# Altium schematic sheet Top_Sheet.SchDoc: Skipper Top Sheet
size 297 x 210 mm; Author: Jack Herron; SheetNumber: 1; SheetTotal: 11
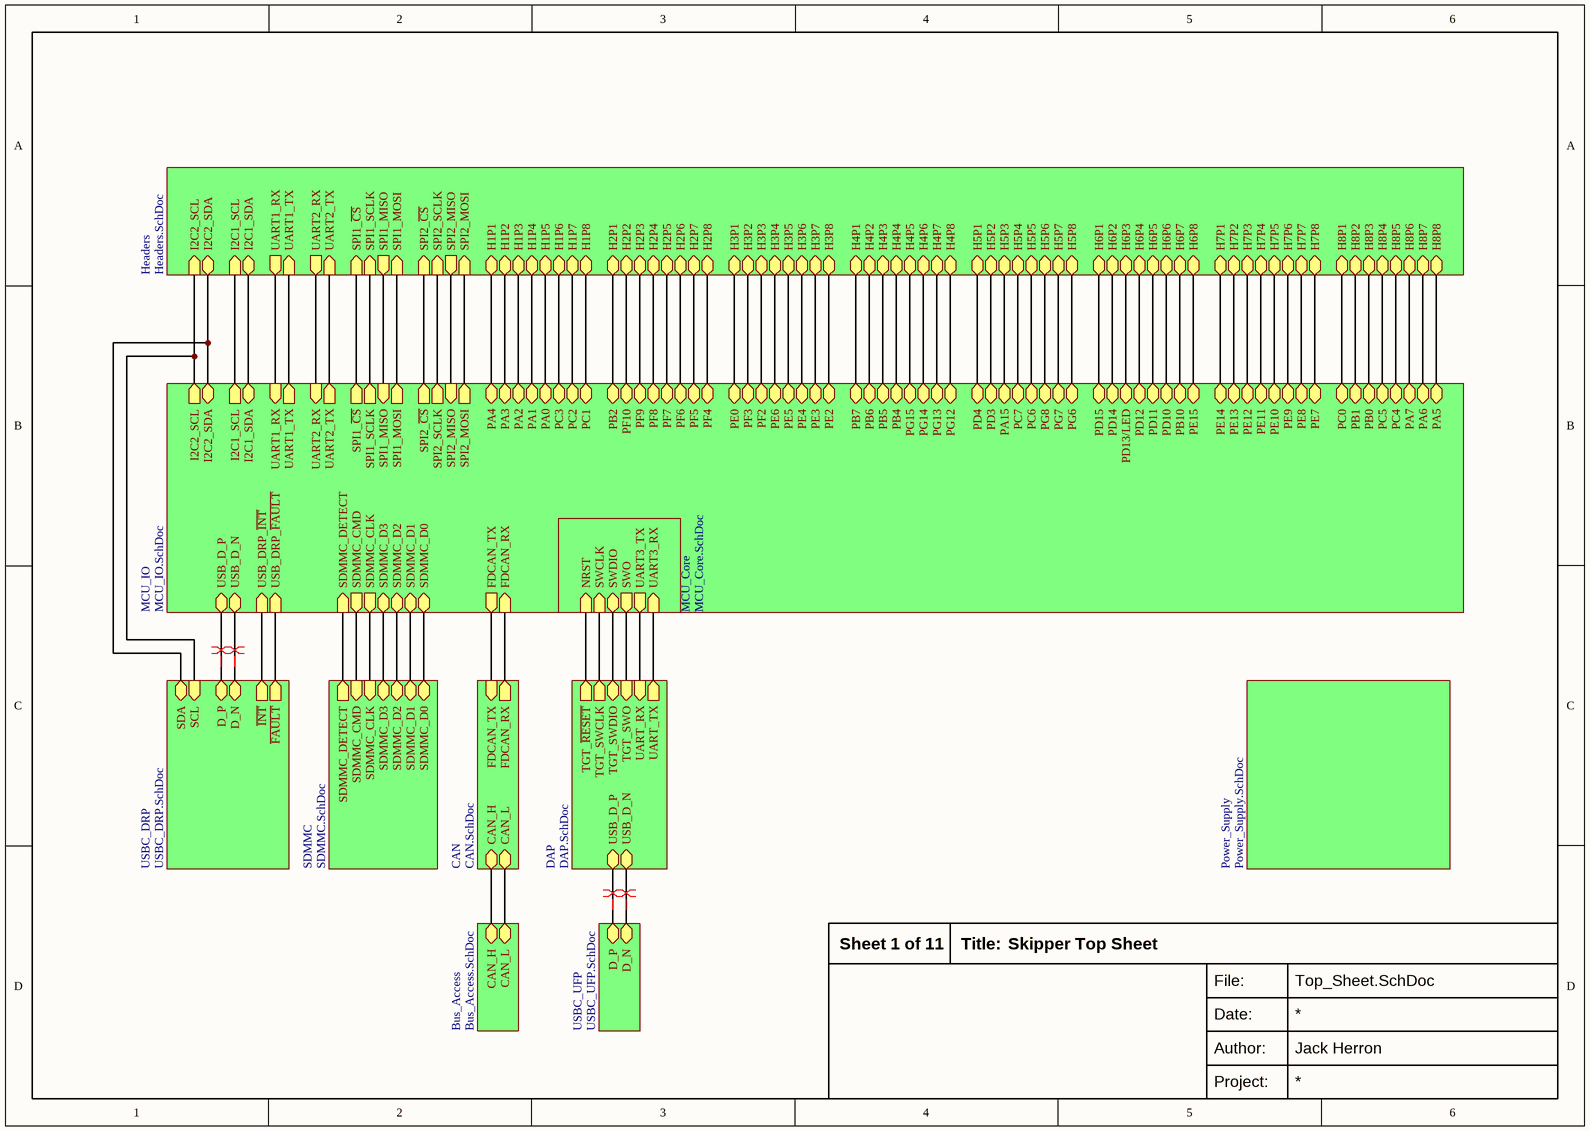
[diagram p0: Top_Sheet.SchDoc]

## Sub-sheets
Bus_Access = Bus_Access.SchDoc: CAN_H (bidir), CAN_L (bidir)
CAN = CAN.SchDoc: CAN_H (bidir), FDCAN_TX (in), FDCAN_RX (out), CAN_L (bidir)
DAP = DAP.SchDoc: TGT_~{RESET} (out), TGT_SWCLK (out), USB_D_N (bidir), USB_D_P (bidir), TGT_SWDIO (bidir), TGT_SWO (in), UART_RX (in), UART_TX (out)
Headers = Headers.SchDoc: H1P1 (bidir), H1P2 (bidir), H1P3 (bidir), H1P4 (bidir), H1P5 (bidir), H1P6 (bidir), H1P7 (bidir), H1P8 (bidir), H2P1 (bidir), H2P2 (bidir), H2P3 (bidir), H2P4 (bidir), H2P5 (bidir), H2P6 (bidir), H2P7 (bidir), H2P8 (bidir), H3P1 (bidir), H3P2 (bidir), H3P3 (bidir), H3P4 (bidir), H3P5 (bidir), H3P6 (bidir), H3P7 (bidir), H3P8 (bidir), SPI1_MOSI (in), SPI1_SCLK (in), SPI1_~{CS} (in), SPI1_MISO (out), SPI2_MISO (out), SPI2_~{CS} (in), SPI2_SCLK (in), SPI2_MOSI (in), UART2_TX (in), UART1_TX (in), UART2_RX (out), UART1_RX (out), H4P1 (bidir), H4P2 (bidir), H4P3 (bidir), H4P4 (bidir), H4P5 (bidir), H4P6 (bidir), H4P7 (bidir), H4P8 (bidir), H5P1 (bidir), H5P2 (bidir), H5P3 (bidir), H5P4 (bidir), H5P5 (bidir), H5P6 (bidir), H5P8 (bidir), H5P7 (bidir), H6P1 (bidir), H6P2 (bidir), H6P3 (bidir), H6P4 (bidir), H6P5 (bidir), H6P6 (bidir), H6P7 (bidir), H6P8 (bidir), H7P1 (bidir), H7P2 (bidir), H7P3 (bidir), H7P4 (bidir), H7P5 (bidir), H7P6 (bidir), H7P7 (bidir), H7P8 (bidir), H8P2 (bidir), H8P1 (bidir), H8P3 (bidir), H8P4 (bidir), H8P5 (bidir), H8P6 (bidir), H8P7 (bidir), H8P8 (bidir), I2C2_SDA (bidir), I2C2_SCL (in), I2C1_SDA (bidir), I2C1_SCL (in)
MCU_Core = MCU_Core.SchDoc: SWDIO (bidir), NRST (in), SWCLK (in), SWO (out), UART3_TX (out), UART3_RX (in)
MCU_IO = MCU_IO.SchDoc: PA4 (bidir), PA3 (bidir), PA2 (bidir), PA1 (bidir), PA0 (bidir), PC3 (bidir), PC2 (bidir), PC1 (bidir), PD4 (bidir), PD3 (bidir), PA15 (bidir), PC7 (bidir), PC6 (bidir), PG8 (bidir), PG7 (bidir), PG6 (bidir), PB2 (bidir), PF10 (bidir), PF9 (bidir), PF8 (bidir), PF7 (bidir), PF6 (bidir), PF5 (bidir), PF4 (bidir), PE0 (bidir), PF3 (bidir), PF2 (bidir), PE6 (bidir), PE5 (bidir), PE4 (bidir), PE3 (bidir), PE2 (bidir), PB7 (bidir), PB6 (bidir), PB5 (bidir), PB4 (bidir), PG15 (bidir), PG14 (bidir), PG13 (bidir), PG12 (bidir), PD15 (bidir), PD14 (bidir), PD13/LED (bidir), PD12 (bidir), PD11 (bidir), PD10 (bidir), PB10 (bidir), PE15 (bidir), PE14 (bidir), PE13 (bidir), PE12 (bidir), PE11 (bidir), PE10 (bidir), PE9 (bidir), PE8 (bidir), PE7 (bidir), PC0 (bidir), PB1 (bidir), PB0 (bidir), PC5 (bidir), PC4 (bidir), PA7 (bidir), PA6 (bidir), PA5 (bidir), SPI2_MOSI (out), SPI2_MISO (in), SPI2_SCLK (out), SPI2_~{CS} (out), SPI1_MOSI (out), SPI1_MISO (in), SPI1_SCLK (out), SPI1_~{CS} (out), UART2_TX (out), UART2_RX (in), UART1_TX (out), UART1_RX (in), USB_D_P (bidir), USB_D_N (bidir), SDMMC_D0 (bidir), SDMMC_D1 (bidir), SDMMC_D2 (bidir), SDMMC_D3 (bidir), SDMMC_CLK (out), SDMMC_CMD (out), SDMMC_DETECT (in), FDCAN_RX (in), FDCAN_TX (out), USB_DRP_~{INT} (in), USB_DRP_~{FAULT} (in), I2C2_SDA (bidir), I2C2_SCL (out), I2C1_SDA (bidir), I2C1_SCL (out)
Power_Supply = Power_Supply.SchDoc: no entries
SDMMC = SDMMC.SchDoc: SDMMC_D0 (bidir), SDMMC_D1 (bidir), SDMMC_D2 (bidir), SDMMC_D3 (bidir), SDMMC_CLK (in), SDMMC_CMD (in), SDMMC_DETECT (out)
USBC_DRP = USBC_DRP.SchDoc: D_P (bidir), D_N (bidir), ~{INT} (out), ~{FAULT} (out), SCL (in), SDA (bidir)
USBC_UFP = USBC_UFP.SchDoc: D_P (bidir), D_N (bidir)

## Nets
(unnamed): sheet MCU_IO/PA4, sheet Headers/H1P1
(unnamed): sheet MCU_IO/PA3, sheet Headers/H1P2
(unnamed): sheet MCU_IO/PA2, sheet Headers/H1P3
(unnamed): sheet MCU_IO/PA1, sheet Headers/H1P4
(unnamed): sheet MCU_IO/PA0, sheet Headers/H1P5
(unnamed): sheet MCU_IO/PC3, sheet Headers/H1P6
(unnamed): sheet MCU_IO/PC2, sheet Headers/H1P7
(unnamed): sheet MCU_IO/PC1, sheet Headers/H1P8
(unnamed): sheet MCU_IO/PD4, sheet Headers/H5P1
(unnamed): sheet MCU_IO/PD3, sheet Headers/H5P2
(unnamed): sheet MCU_IO/PA15, sheet Headers/H5P3
(unnamed): sheet MCU_IO/PC7, sheet Headers/H5P4
(unnamed): sheet MCU_IO/PC6, sheet Headers/H5P5
(unnamed): sheet MCU_IO/PG8, sheet Headers/H5P6
(unnamed): sheet MCU_IO/PG7, sheet Headers/H5P7
(unnamed): sheet MCU_IO/PG6, sheet Headers/H5P8
(unnamed): sheet MCU_IO/PB2, sheet Headers/H2P1
(unnamed): sheet MCU_IO/PF10, sheet Headers/H2P2
(unnamed): sheet MCU_IO/PF9, sheet Headers/H2P3
(unnamed): sheet MCU_IO/PF8, sheet Headers/H2P4
(unnamed): sheet MCU_IO/PF7, sheet Headers/H2P5
(unnamed): sheet MCU_IO/PF6, sheet Headers/H2P6
(unnamed): sheet MCU_IO/PF5, sheet Headers/H2P7
(unnamed): sheet MCU_IO/PF4, sheet Headers/H2P8
(unnamed): sheet MCU_IO/PE0, sheet Headers/H3P1
(unnamed): sheet MCU_IO/PF3, sheet Headers/H3P2
(unnamed): sheet MCU_IO/PF2, sheet Headers/H3P3
(unnamed): sheet MCU_IO/PE6, sheet Headers/H3P4
(unnamed): sheet MCU_IO/PE5, sheet Headers/H3P5
(unnamed): sheet MCU_IO/PE4, sheet Headers/H3P6
(unnamed): sheet MCU_IO/PE3, sheet Headers/H3P7
(unnamed): sheet MCU_IO/PE2, sheet Headers/H3P8
(unnamed): sheet MCU_IO/PB7, sheet Headers/H4P1
(unnamed): sheet MCU_IO/PB6, sheet Headers/H4P2
(unnamed): sheet MCU_IO/PB5, sheet Headers/H4P3
(unnamed): sheet MCU_IO/PB4, sheet Headers/H4P4
(unnamed): sheet MCU_IO/PG15, sheet Headers/H4P5
(unnamed): sheet MCU_IO/PG14, sheet Headers/H4P6
(unnamed): sheet MCU_IO/PG13, sheet Headers/H4P7
(unnamed): sheet MCU_IO/PG12, sheet Headers/H4P8
(unnamed): sheet MCU_IO/PD15, sheet Headers/H6P1
(unnamed): sheet MCU_IO/PD14, sheet Headers/H6P2
(unnamed): sheet MCU_IO/PD13/LED, sheet Headers/H6P3
(unnamed): sheet MCU_IO/PD12, sheet Headers/H6P4
(unnamed): sheet MCU_IO/PD11, sheet Headers/H6P5
(unnamed): sheet MCU_IO/PD10, sheet Headers/H6P6
(unnamed): sheet MCU_IO/PB10, sheet Headers/H6P7
(unnamed): sheet MCU_IO/PE15, sheet Headers/H6P8
(unnamed): sheet MCU_IO/PE14, sheet Headers/H7P1
(unnamed): sheet MCU_IO/PE13, sheet Headers/H7P2
(unnamed): sheet MCU_IO/PE12, sheet Headers/H7P3
(unnamed): sheet MCU_IO/PE11, sheet Headers/H7P4
(unnamed): sheet MCU_IO/PE10, sheet Headers/H7P5
(unnamed): sheet MCU_IO/PE9, sheet Headers/H7P6
(unnamed): sheet MCU_IO/PE8, sheet Headers/H7P7
(unnamed): sheet MCU_IO/PE7, sheet Headers/H7P8
(unnamed): sheet MCU_IO/PC0, sheet Headers/H8P1
(unnamed): sheet MCU_IO/PB1, sheet Headers/H8P2
(unnamed): sheet MCU_IO/PB0, sheet Headers/H8P3
(unnamed): sheet MCU_IO/PC5, sheet Headers/H8P4
(unnamed): sheet MCU_IO/PC4, sheet Headers/H8P5
(unnamed): sheet MCU_IO/PA7, sheet Headers/H8P6
(unnamed): sheet MCU_IO/PA6, sheet Headers/H8P7
(unnamed): sheet MCU_IO/PA5, sheet Headers/H8P8
(unnamed): sheet MCU_IO/SPI2_MOSI, sheet Headers/SPI2_MOSI
(unnamed): sheet MCU_IO/SPI2_MISO, sheet Headers/SPI2_MISO
(unnamed): sheet MCU_IO/SPI2_SCLK, sheet Headers/SPI2_SCLK
(unnamed): sheet MCU_IO/SPI2_~{CS}, sheet Headers/SPI2_~{CS}
(unnamed): sheet MCU_IO/SPI1_MOSI, sheet Headers/SPI1_MOSI
(unnamed): sheet MCU_IO/SPI1_MISO, sheet Headers/SPI1_MISO
(unnamed): sheet MCU_IO/SPI1_SCLK, sheet Headers/SPI1_SCLK
(unnamed): sheet MCU_IO/SPI1_~{CS}, sheet Headers/SPI1_~{CS}
(unnamed): sheet MCU_IO/UART2_TX, sheet Headers/UART2_TX
(unnamed): sheet MCU_IO/UART2_RX, sheet Headers/UART2_RX
(unnamed): sheet MCU_IO/UART1_TX, sheet Headers/UART1_TX
(unnamed): sheet MCU_IO/UART1_RX, sheet Headers/UART1_RX
(unnamed): sheet MCU_IO/USB_D_P, sheet USBC_DRP/D_P
(unnamed): sheet MCU_IO/USB_D_N, sheet USBC_DRP/D_N
(unnamed): sheet MCU_IO/SDMMC_D0, sheet SDMMC/SDMMC_D0
(unnamed): sheet MCU_IO/SDMMC_D1, sheet SDMMC/SDMMC_D1
(unnamed): sheet MCU_IO/SDMMC_D2, sheet SDMMC/SDMMC_D2
(unnamed): sheet MCU_IO/SDMMC_D3, sheet SDMMC/SDMMC_D3
(unnamed): sheet MCU_IO/SDMMC_CLK, sheet SDMMC/SDMMC_CLK
(unnamed): sheet MCU_IO/SDMMC_CMD, sheet SDMMC/SDMMC_CMD
(unnamed): sheet MCU_IO/SDMMC_DETECT, sheet SDMMC/SDMMC_DETECT
(unnamed): sheet MCU_IO/FDCAN_RX, sheet CAN/FDCAN_RX
(unnamed): sheet MCU_IO/FDCAN_TX, sheet CAN/FDCAN_TX
(unnamed): sheet MCU_IO/USB_DRP_~{INT}, sheet USBC_DRP/~{INT}
(unnamed): sheet MCU_IO/USB_DRP_~{FAULT}, sheet USBC_DRP/~{FAULT}
(unnamed): sheet MCU_IO/I2C2_SDA, sheet USBC_DRP/SDA, sheet Headers/I2C2_SDA
(unnamed): sheet MCU_IO/I2C2_SCL, sheet USBC_DRP/SCL, sheet Headers/I2C2_SCL
(unnamed): sheet MCU_IO/I2C1_SDA, sheet Headers/I2C1_SDA
(unnamed): sheet MCU_IO/I2C1_SCL, sheet Headers/I2C1_SCL
(unnamed): sheet MCU_Core/SWDIO, sheet DAP/TGT_SWDIO
(unnamed): sheet MCU_Core/NRST, sheet DAP/TGT_~{RESET}
(unnamed): sheet MCU_Core/SWCLK, sheet DAP/TGT_SWCLK
(unnamed): sheet MCU_Core/SWO, sheet DAP/TGT_SWO
(unnamed): sheet MCU_Core/UART3_TX, sheet DAP/UART_RX
(unnamed): sheet MCU_Core/UART3_RX, sheet DAP/UART_TX
(unnamed): sheet USBC_UFP/D_P, sheet DAP/USB_D_P
(unnamed): sheet USBC_UFP/D_N, sheet DAP/USB_D_N
(unnamed): sheet CAN/CAN_H, sheet Bus_Access/CAN_H
(unnamed): sheet CAN/CAN_L, sheet Bus_Access/CAN_L

## Layout directives
differential pair: (no net found under the mark)

## Notes on the sheet
- Title:
- File:
- Date:
- Project:
- Author: